# Altium project ArmBand-Sensor-Board.PrjPcb
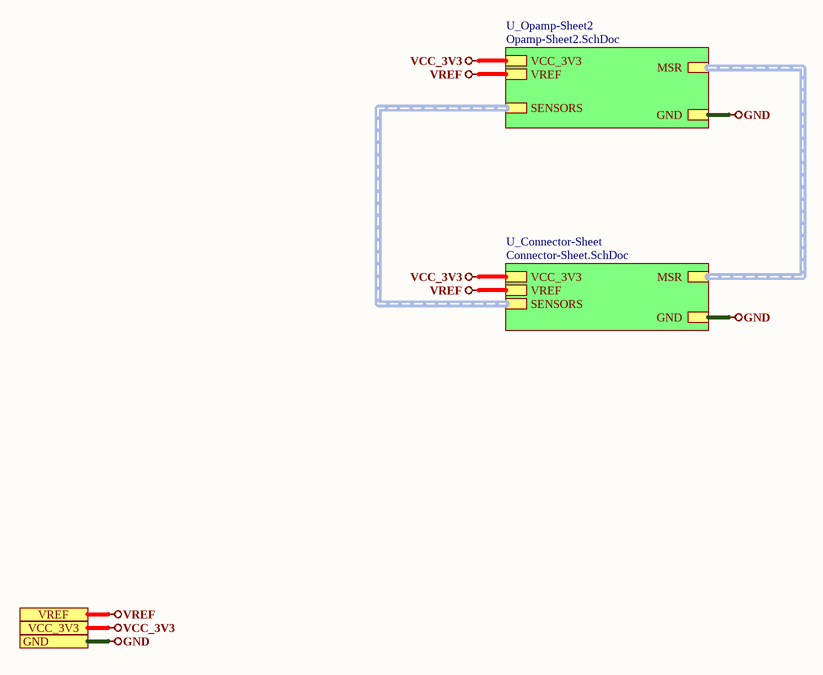
[diagram p0: Top-Sheet.SchDoc]
3 sheets, 26 parts. Net scope: hierarchical (ports join the sheet entries above them; power ports are global).
Board file: ArmBand-Sensor-Board.PcbDoc
Sheets:
  Top-Sheet.SchDoc
    U_Opamp-Sheet2 = Opamp-Sheet2.SchDoc
    U_Connector-Sheet = Connector-Sheet.SchDoc

## Sheet Top-Sheet.SchDoc
size A4; SheetNumber: 1; SheetTotal: 3

### Sub-sheets
U_Connector-Sheet = Connector-Sheet.SchDoc: SENSORS (harness SENSORS), VCC_3V3, GND, MSR (harness MSR), VREF
U_Opamp-Sheet2 = Opamp-Sheet2.SchDoc: VCC_3V3, GND, VREF, SENSORS (harness SENSORS), MSR (harness MSR)

### Ports
GND, VCC_3V3, VREF

### Nets
GND: port GND, sheet U_Opamp-Sheet2/GND, sheet U_Connector-Sheet/GND
VCC_3V3: port VCC_3V3, sheet U_Opamp-Sheet2/VCC_3V3, sheet U_Connector-Sheet/VCC_3V3
VREF: port VREF, sheet U_Opamp-Sheet2/VREF, sheet U_Connector-Sheet/VREF

### Buses and harness runs
harness sheet U_Connector-Sheet/MSR = sheet U_Opamp-Sheet2/MSR
harness sheet U_Connector-Sheet/SENSORS = sheet U_Opamp-Sheet2/SENSORS

### Notes on the sheet
- 1
- Huzaifa Ali

## Sheet Opamp-Sheet2.SchDoc
size A4; SheetNumber: 2; SheetTotal: 3
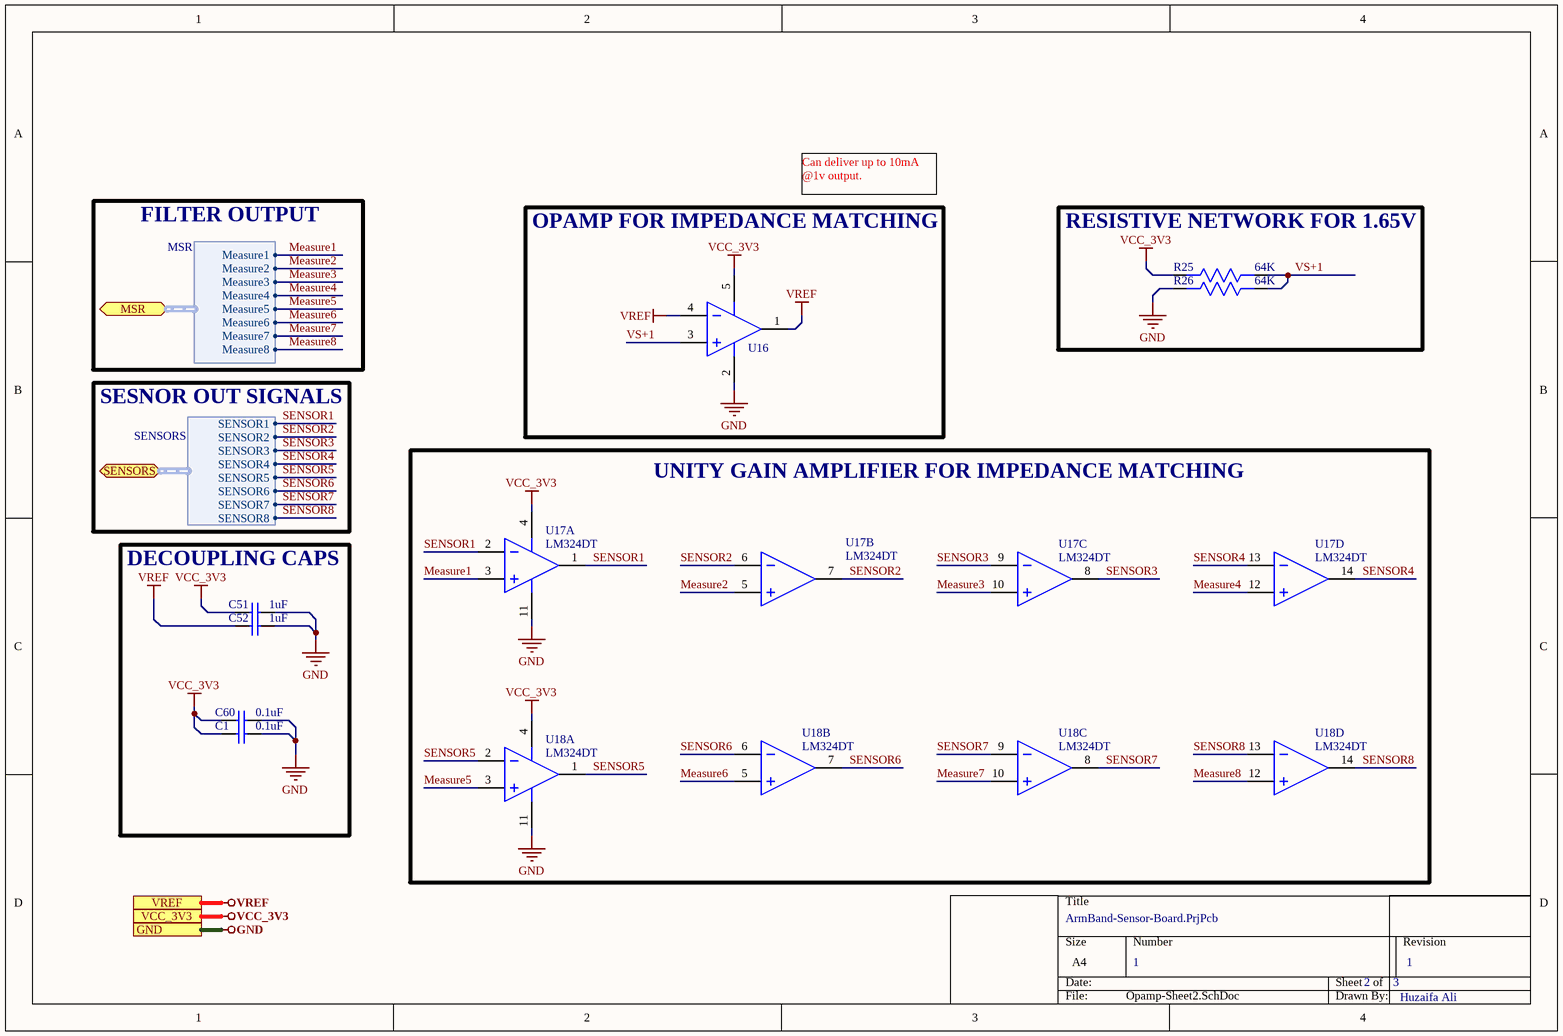
[diagram p1: Opamp-Sheet2.SchDoc]

### Parts
C1  0.1uF  [Cap 0402]
C51  1uF  [Cap 0402]
C52  1uF  [Cap 0402]
C60  0.1uF  [Cap 0402]
R25  64K  [Res0603]
R26  64K  [Res0603]
U16  TPMCP6021T-E/OT  [SOT-23-5]  (value not drawn)
U17  LM324DT  [SO-14]  (parts A,B,C,D of 4)
U18  LM324DT  [SO-14]  (parts A,B,C,D of 4)

### Blocks framed on the sheet
OPAMP FOR IMPEDANCE MATCHING: U16
RESISTIVE NETWORK FOR 1.65V: R25 R26
UNITY GAIN AMPLIFIER FOR IMPEDANCE MATCHING: U17 U18
DECOUPLING CAPS: C1 C51 C52 C60

### Ports
GND, MSR (bidir, harness MSR), SENSORS (bidir, harness SENSORS), VCC_3V3, VREF

### Harnesses
SENSORS: SENSOR1, SENSOR2, SENSOR3, SENSOR4, SENSOR5, SENSOR6, SENSOR7, SENSOR8
MSR: Measure1, Measure2, Measure3, Measure4, Measure5, Measure6, Measure7, Measure8

### Nets
GND: C1.2 C51.2 C52.2 C60.2 R26.2 U16.2(V-) U17.11(VCC-) U18.11(VCC-) ; port GND
VCC_3V3: C1.1 C51.1 C60.1 R25.2 U16.5(V+) U17.4(VCC+) U18.4(VCC+) ; port VCC_3V3
VREF: C52.1 U16.1(OUT) U16.4(IN-) ; port VREF
Measure1: U17.3(IN+) ; port MSR.Measure1
Measure2: U17.5(2IN+) ; port MSR.Measure2
Measure3: U17.10(3IN+) ; port MSR.Measure3
Measure4: U17.12(4IN+) ; port MSR.Measure4
Measure5: U18.3(IN+) ; port MSR.Measure5
Measure6: U18.5(2IN+) ; port MSR.Measure6
Measure7: U18.10(3IN+) ; port MSR.Measure7
Measure8: U18.12(4IN+) ; port MSR.Measure8
SENSOR1: U17.1(1OUT) U17.2(IN-) ; port SENSORS.SENSOR1
SENSOR2: U17.6(2IN-) U17.7(2OUT) ; port SENSORS.SENSOR2
SENSOR3: U17.8(3OUT) U17.9(3IN-) ; port SENSORS.SENSOR3
SENSOR4: U17.13(4IN-) U17.14(4OUT) ; port SENSORS.SENSOR4
SENSOR5: U18.1(1OUT) U18.2(IN-) ; port SENSORS.SENSOR5
SENSOR6: U18.6(2IN-) U18.7(2OUT) ; port SENSORS.SENSOR6
SENSOR7: U18.8(3OUT) U18.9(3IN-) ; port SENSORS.SENSOR7
SENSOR8: U18.13(4IN-) U18.14(4OUT) ; port SENSORS.SENSOR8
VS+1: R25.1 R26.1 U16.3(IN+)

### Notes on the sheet
- FILTER OUTPUT
- Can deliver up to 10mA @1v output.
- SESNOR OUT SIGNALS
- 1
- Huzaifa Ali

### Library data of the parts
C1 C60 = GRM155R71H104ME14D: CAP CER 0.1UF 50V X7R 0402; Manufacturer: Murata; Tolerance: 20%; Capacitance: 100nF; Supplier 1: Digi-Key; Manufacturer Part Number: GRM155R71H104ME14D; Stock 1: 439844; Pricing 1: 1=0.1, 10=0.038, 100=0.0168, 500=0.01198, 1000=0.00941, 2500=0.00855, 5000=0.00787 (USD); Mount: Surface Mount; Case/Package: 0402; Min Operating Temperature: -55°C; Max Operating Temperature: 125°C; Packaging: Cut Tape; Voltage Rating: 50V; Length: 0.039inch; Width: 0.02inch; Thickness: 0.022inch; ComponentLink1URL: http://search.murata.co.jp/Ceramy/image/img/A01X/G101/ENG/GRM155R71H104ME14-01.pdf?src-supplier=Digi-Key; ComponentLink1Description: http://search.murata.co.jp/Ceramy/image/img/A01X/G101/ENG/GRM155R71H104ME14-01.pdf?src-supplier=Digi-Key; ComponentLink2URL: http://psearch.en.murata.com/capacitor/product/GRM155R71H104ME14%23.pdf?src-supplier=Avnet; ComponentLink2Description: http://psearch.en.murata.com/capacitor/product/GRM155R71H104ME14%23.pdf?src-supplier=Avnet; ComponentLink3URL: http://components.arrow.com/part/dataview/0323_07177683?src-supplier=Arrow+Europe; ComponentLink3Description: http://components.arrow.com/part/dataview/0323_07177683?src-supplier=Arrow+Europe; ComponentLink4URL: http://www.mouser.com/ds/2/281/c02e-2905.pdf?src-supplier=Mouser; ComponentLink4Description: http://www.mouser.com/ds/2/281/c02e-2905.pdf?src-supplier=Mouser; Supplier Part Number 1: 490-10701-1-ND
C51 C52 = CC0402KRX5R7BB105: CAP CER 1UF 16V X5R 0402; Manufacturer: Yageo; Tolerance: 10%; Supplier 1: Digi-Key; Manufacturer Part Number: CC0402KRX5R7BB105; Stock 1: 1405667; Pricing 1: 1=0.36, 10=0.252, 100=0.1512, 500=0.1134, 1000=0.09576, 2500=0.09072, 5000=0.08568 (USD); Mount: Surface Mount; Case/Package: 0402; Weight: 2.3E-05oz; Case Code (Imperial): 0402; Case Code (Metric): 1005; Min Operating Temperature: -55°C; Max Operating Temperature: 85°C; Capacitance: 1uF; Dielectric: X5R; Packaging: Tape and Reel; Voltage Rating (DC): 16V; Voltage Rating: 16V; Termination: SMD/SMT; Composition: Ceramic; Length: 1mm; Height: 0.5mm; Width: 0.02inch; Thickness: 0.022inch; Depth: 0.5mm; Radiation Hardening: No; Lead Free: Lead Free; Halogen Free: Halogen Free; ComponentLink1URL: http://www.yageo.com/documents/recent/UPY-GPHC_X5R_4V-to-50V_12.pdf?src-supplier=Avnet+Europe; ComponentLink1Description: http://www.yageo.com/documents/recent/UPY-GPHC_X5R_4V-to-50V_12.pdf?src-supplier=Avnet+Europe; Supplier Part Number 1: 311-1691-6-ND
R25 R26 = ARG03DTC6402N: 1/10W Thin Film Resistor 75V ±0.5% ±25ppm/℃ -55℃~+155℃ 64kΩ 0603 Chip Resistor - Surface Mount ROHS; Manufacturer: iking Tech; Manufacture Part num:: ARG03DTC6402N; Package: 0603; VAlue: 64K
U16 = TPMCP6021T-E/OT: SOT-23-5 Operational Amplifier ROHS; Manufacturer: TECH PUBLIC; Manufacturer Part Number: TPMCP6021T-E/OT
U17 U18 = LM324DT: IC OPAMP GP 1.3MHZ 14SO; Manufacturer: STMicroelectronics; Max Supply Voltage: 30V; Min Supply Voltage: 3V; Min Dual Supply Voltage: 1.5V; Max Dual Supply Voltage: 15V; Voltage Gain: 100dB; Slew Rate: 0.4V/µs; Common Mode Rejection Ratio: 70dB; Nominal Supply Current: 1.2mA; Input Offset Voltage (Vos): 7mV; Input Bias Current: 150nA; Number of Circuits: 4; Output Current per Channel: 40mA; Dual Supply Voltage: 12V; Supply Type: Single,Dual; Input Voltage Noise Density: 40nV/sqrt Hz; Max Power Dissipation: 400mW; Supplier 1: Arrow Electronics; Manufacturer Part Number: LM324DT; RoHS: Yes; Category: Amplifiers - Op Amps, Buffer, Instrumentation; Stock 1: 287500; Pricing 1: 2500=0.18900 (USD); Mount: Surface Mount; Case/Package: SO; Number of Pins: 14; Contact Plating: Tin,Matte; Weight: 0.009143oz; Min Operating Temperature: 0°C; Max Operating Temperature: 70°C; Gain Bandwidth Product: 1.3MHz; Packaging: Cut Tape; Package Quantity: 2500; Operating Supply Current: 1.2mA; Operating Supply Voltage: 15V; Number of Channels: 4; Output Current: 40mA; Number of Elements: 4; Series: LM324; Technology: BIPOLAR; Bandwidth: 1.3MHz; Number of Amplifiers: 4; Unity Gain Bandwidth Product: 1.3MHz; Length: 8.75mm; Width: 4mm; Height: 1.65mm; Radiation Hardening: No; RoHS Compliant: Yes; Lead Free: Lead Free; REACH SVHC: No SVHC; ComponentLink1URL: https://datasheet.ciiva.com/4758/cd00000457-103203-4758032.pdf?src-supplier=Mouser; ComponentLink1Description: https://datasheet.ciiva.com/4758/cd00000457-103203-4758032.pdf?src-supplier=Mouser; ComponentLink2URL: https://datasheet.ciiva.com/8008/1834360-8008827.pdf?src-supplier=Element14; ComponentLink2Description: https://datasheet.ciiva.com/8008/1834360-8008827.pdf?src-supplier=Element14; ComponentLink3URL: https://datasheet.ciiva.com/8008/1834360-8008490.pdf?src-supplier=Element14; ComponentLink3Description: https://datasheet.ciiva.com/8008/1834360-8008490.pdf?src-supplier=Element14; ComponentLink4URL: https://datasheet.ciiva.com/28630/1834360-28630538.pdf?src-supplier=Element14; ComponentLink4Description: https://datasheet.ciiva.com/28630/1834360-28630538.pdf?src-supplier=Element14; ComponentLink5URL: https://datasheet.ciiva.com/1795/cd00000457-1795560.pdf?src-supplier=Digi-Key; ComponentLink5Description: https://datasheet.ciiva.com/1795/cd00000457-1795560.pdf?src-supplier=Digi-Key; ComponentLink6URL: https://datasheet.ciiva.com/1795/cd00000457-1795559.pdf?src-supplier=Digi-Key; ComponentLink6Description: https://datasheet.ciiva.com/1795/cd00000457-1795559.pdf?src-supplier=Digi-Key; ComponentLink7URL: https://datasheet.ciiva.com/1795/cd00000457-1795561.pdf?src-supplier=Digi-Key; ComponentLink7Description: https://datasheet.ciiva.com/1795/cd00000457-1795561.pdf?src-supplier=Digi-Key; ComponentLink8URL: https://datasheet.ciiva.com/16375/cd00000457-16375528.pdf?src-supplier=Future+Electronics; ComponentLink8Description: https://datasheet.ciiva.com/16375/cd00000457-16375528.pdf?src-supplier=Future+Electronics; Supplier Part Number 1: LM324DT

## Sheet Connector-Sheet.SchDoc
size A4; SheetNumber: 3; SheetTotal: 3
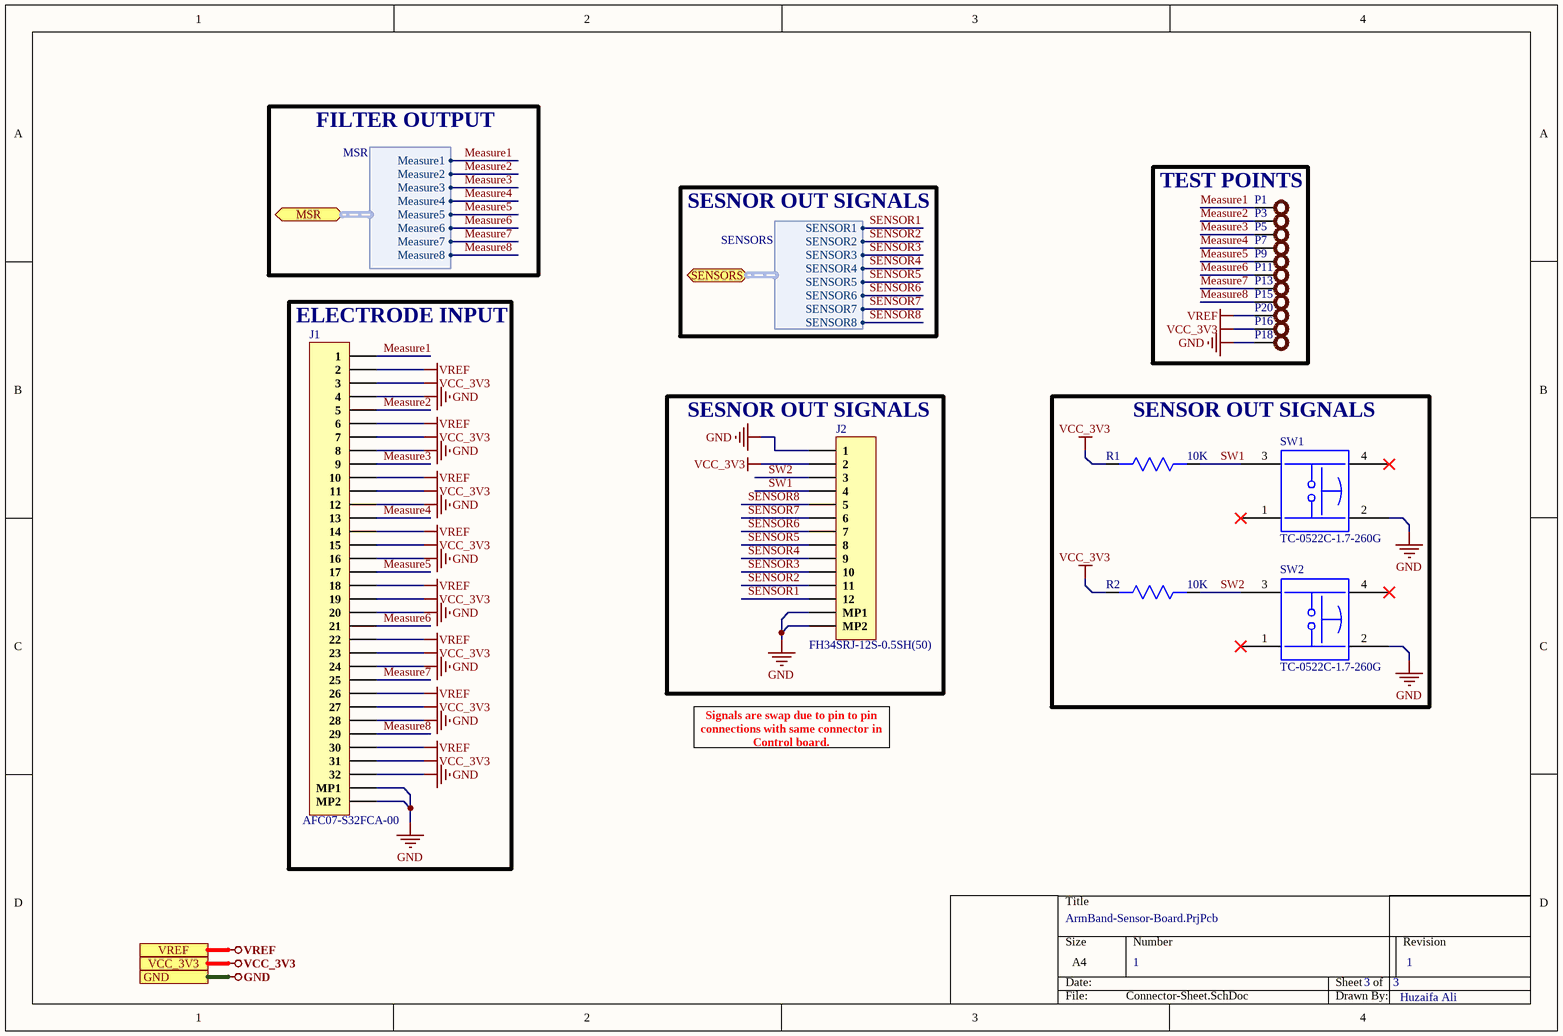
[diagram p2: Connector-Sheet.SchDoc]

### Parts
J1  AFC07-S32FCA-00  [AFC07-S32FCA-00]
J2  FH34SRJ-12S-0.5SH(50)  [FH34SRJ-12S-0.5SH(50)]
P1  Test Point  [TEST POINT]  (value not drawn)
P3  Test Point  [TEST POINT]  (value not drawn)
P5  Test Point  [TEST POINT]  (value not drawn)
P7  Test Point  [TEST POINT]  (value not drawn)
P9  Test Point  [TEST POINT]  (value not drawn)
P11  Test Point  [TEST POINT]  (value not drawn)
P13  Test Point  [TEST POINT]  (value not drawn)
P15  Test Point  [TEST POINT]  (value not drawn)
P16  Test Point  [TEST POINT]  (value not drawn)
P18  Test Point  [TEST POINT]  (value not drawn)
P20  Test Point  [TEST POINT]  (value not drawn)
R1  10K  [Res0402]
R2  10K  [Res0402]
SW1  TC-0522C-1.7-260G  [TC-0522C-1.7-260G]
SW2  TC-0522C-1.7-260G  [TC-0522C-1.7-260G]

### Blocks framed on the sheet
TEST POINTS: P1 P3 P5 P7 P9 P11 P13 P15 P16 P18 P20
ELECTRODE INPUT: J1
SESNOR OUT SIGNALS: J2
SENSOR OUT SIGNALS: R1 R2 SW1 SW2

### Ports
GND, MSR (bidir, harness MSR), SENSORS (bidir, harness SENSORS), VCC_3V3, VREF

### Harnesses
SENSORS: SENSOR1, SENSOR2, SENSOR3, SENSOR4, SENSOR5, SENSOR6, SENSOR7, SENSOR8
MSR: Measure1, Measure2, Measure3, Measure4, Measure5, Measure6, Measure7, Measure8

### Nets
GND: J1.4 J1.8 J1.12 J1.16 J1.20 J1.24 J1.28 J1.32 J1.MP1 J1.MP2 J2.1 J2.MP1 J2.MP2 P18.1 SW1.2 SW2.2 ; port GND
VCC_3V3: J1.3 J1.7 J1.11 J1.15 J1.19 J1.23 J1.27 J1.31 J2.2 P16.1 R1.2 R2.2 ; port VCC_3V3
VREF: J1.2 J1.6 J1.10 J1.14 J1.18 J1.22 J1.26 J1.30 P20.1 ; port VREF
Measure1: J1.1 P1.1 ; port MSR.Measure1
Measure2: J1.5 P3.1 ; port MSR.Measure2
Measure3: J1.9 P5.1 ; port MSR.Measure3
Measure4: J1.13 P7.1 ; port MSR.Measure4
Measure5: J1.17 P9.1 ; port MSR.Measure5
Measure6: J1.21 P11.1 ; port MSR.Measure6
Measure7: J1.25 P13.1 ; port MSR.Measure7
Measure8: J1.29 P15.1 ; port MSR.Measure8
SENSOR1: J2.12 ; port SENSORS.SENSOR1
SENSOR2: J2.11 ; port SENSORS.SENSOR2
SENSOR3: J2.10 ; port SENSORS.SENSOR3
SENSOR4: J2.9 ; port SENSORS.SENSOR4
SENSOR5: J2.8 ; port SENSORS.SENSOR5
SENSOR6: J2.7 ; port SENSORS.SENSOR6
SENSOR7: J2.6 ; port SENSORS.SENSOR7
SENSOR8: J2.5 ; port SENSORS.SENSOR8
SW1: J2.4 R1.1 SW1.3
SW2: J2.3 R2.1 SW2.3

Not connected (* = marked no-connect by the designer): SW1 1* 4*; SW2 1* 4*

### Notes on the sheet
- FILTER OUTPUT
- SESNOR OUT SIGNALS
- Signals are swap due to pin to pin connections with same connector in Control board.
- 1
- Huzaifa Ali

### Library data of the parts
J1 = AFC07-S32FCA-00: Slide Lock 32 Bottom Contact Surface Mount 0.5mm SMD,P=0.5mm FFC/FPC Connectors ROHS; Manufacturer: JUSHUO; Manufacturer Part Number: AFC07-S32FCA-00; Footprint: Custom; ComponentLink1Description: LCSC; ComponentLink1URL: https://lcsc.com/product-detail/FFC-FPC-Connectors_JUSHUO-AFC07-S32FCA-00_C262570.html
J2 = FH34SRJ-12S-0.5SH(50): CONN FPC/FFC 12POS .5MM; Manufacturer: Hirose; Supplier 1: Digi-Key; Manufacturer Part Number: FH34SRJ-12S-0.5SH(50); RoHS: Yes; Category: FFC / FPC; Pricing 1: 5000=0.47775 (USD); ComponentLink1URL: https://www.hirose.com/product/en/download_file/key_name/FH34SRJ/category/Catalog/doc_file_id/31646/?file_category_id=4&item_id=27&is_series=1&src-supplier=Digi-Key; ComponentLink1Description: https://www.hirose.com/product/en/download_file/key_name/FH34SRJ/category/Catalog/doc_file_id/31646/?file_category_id=4&item_id=27&is_series=1&src-supplier=Digi-Key; Supplier Part Number 1: FH34SRJ-12S-0.5SH(50)-ND
P1 P3 P5 P7 P9 P11 P13 P15 P16 P18 P20 = TEST POINT: Test Point ON
R1 R2 = RC0402FR-0710KL: RES SMD 10K OHM 1% 1/16W 0402; Manufacturer: Yageo; Resistance: 10kR; Temperature Coefficient: 100ppm/°C; Voltage Rating (DC): 50V; Power Rating: 62.5mW; Supplier 1: Digi-Key; Manufacturer Part Number: RC0402FR-0710KL; Stock 1: 60122563; Pricing 1: 1=0.1, 10=0.016, 100=0.0064, 1000=0.00289, 2500=0.00251, 5000=0.00207 (USD); Case/Package: 0402; Number of Pins: 2; Case Code (Imperial): 0402; Case Code (Metric): 1005; Min Operating Temperature: -55°C; Max Operating Temperature: 155°C; Composition: Thick Film; Tolerance: 1%; Packaging: Tape and Reel; Voltage Rating: 50V; Termination: SMD/SMT; Military Standard: Not; Working Voltage: 50V; Number of Terminations: 2; Length: 1mm; Height: 0.32mm; Width: 0.5mm; Depth: 0.5mm; Lead Pitch: 0.2mm; REACH SVHC: No SVHC; Lead Free: Lead Free; ComponentLink1URL: http://www.farnell.com/datasheets/2167052.pdf?src-supplier=Element14; ComponentLink1Description: http://www.farnell.com/datasheets/2167052.pdf?src-supplier=Element14; ComponentLink2URL: http://www.farnell.com/datasheets/1686128.pdf?src-supplier=Element14; ComponentLink2Description: http://www.farnell.com/datasheets/1686128.pdf?src-supplier=Element14; ComponentLink3URL: http://www.farnell.com/datasheets/1784430.pdf?src-supplier=Element14; ComponentLink3Description: http://www.farnell.com/datasheets/1784430.pdf?src-supplier=Element14; ComponentLink4URL: http://www.yageo.com/documents/recent/PYu-RC_Group_51_RoHS_L_9.pdf?src-supplier=Mouser; ComponentLink4Description: http://www.yageo.com/documents/recent/PYu-RC_Group_51_RoHS_L_9.pdf?src-supplier=Mouser; Supplier Part Number 1: 311-10.0KLRDKR-ND
SW1 SW2 = TC-0522C-1.7-260G: No Gull Wing 50mA 100MΩ 80000 260gf@±50gf 12V -25℃~+85℃ 1.7mm Golden Round Button Brick nogging SPST SMD Tactile Switches ROHS; Manufacturer: HCTL; Manufacturer Part Number: TC-0522C-1.7-260G; Value: -; Footprint: Custom; ComponentLink1Description: LCSC; ComponentLink1URL: https://www.lcsc.com/product-detail/Tactile-Switches_HCTL-TC-0522C-1-7-260G_C2845290.html

## Nets that join several sheets
GND: Opamp-Sheet2 (8 pins), Connector-Sheet (16 pins)
VCC_3V3: Opamp-Sheet2 (7 pins), Connector-Sheet (12 pins)
VREF: Opamp-Sheet2 (C52.1 U16.1 U16.4), Connector-Sheet (9 pins)
Measure1: Opamp-Sheet2 (U17.3), Connector-Sheet (J1.1 P1.1)
Measure2: Opamp-Sheet2 (U17.5), Connector-Sheet (J1.5 P3.1)
Measure3: Opamp-Sheet2 (U17.10), Connector-Sheet (J1.9 P5.1)
Measure4: Opamp-Sheet2 (U17.12), Connector-Sheet (J1.13 P7.1)
Measure5: Opamp-Sheet2 (U18.3), Connector-Sheet (J1.17 P9.1)
Measure6: Opamp-Sheet2 (U18.5), Connector-Sheet (J1.21 P11.1)
Measure7: Opamp-Sheet2 (U18.10), Connector-Sheet (J1.25 P13.1)
Measure8: Opamp-Sheet2 (U18.12), Connector-Sheet (J1.29 P15.1)
SENSOR1: Opamp-Sheet2 (U17.1 U17.2), Connector-Sheet (J2.12)
SENSOR2: Opamp-Sheet2 (U17.6 U17.7), Connector-Sheet (J2.11)
SENSOR3: Opamp-Sheet2 (U17.8 U17.9), Connector-Sheet (J2.10)
SENSOR4: Opamp-Sheet2 (U17.13 U17.14), Connector-Sheet (J2.9)
SENSOR5: Opamp-Sheet2 (U18.1 U18.2), Connector-Sheet (J2.8)
SENSOR6: Opamp-Sheet2 (U18.6 U18.7), Connector-Sheet (J2.7)
SENSOR7: Opamp-Sheet2 (U18.8 U18.9), Connector-Sheet (J2.6)
SENSOR8: Opamp-Sheet2 (U18.13 U18.14), Connector-Sheet (J2.5)